# Altium schematic sheet UC3842.SchDoc (part 2 of 2)
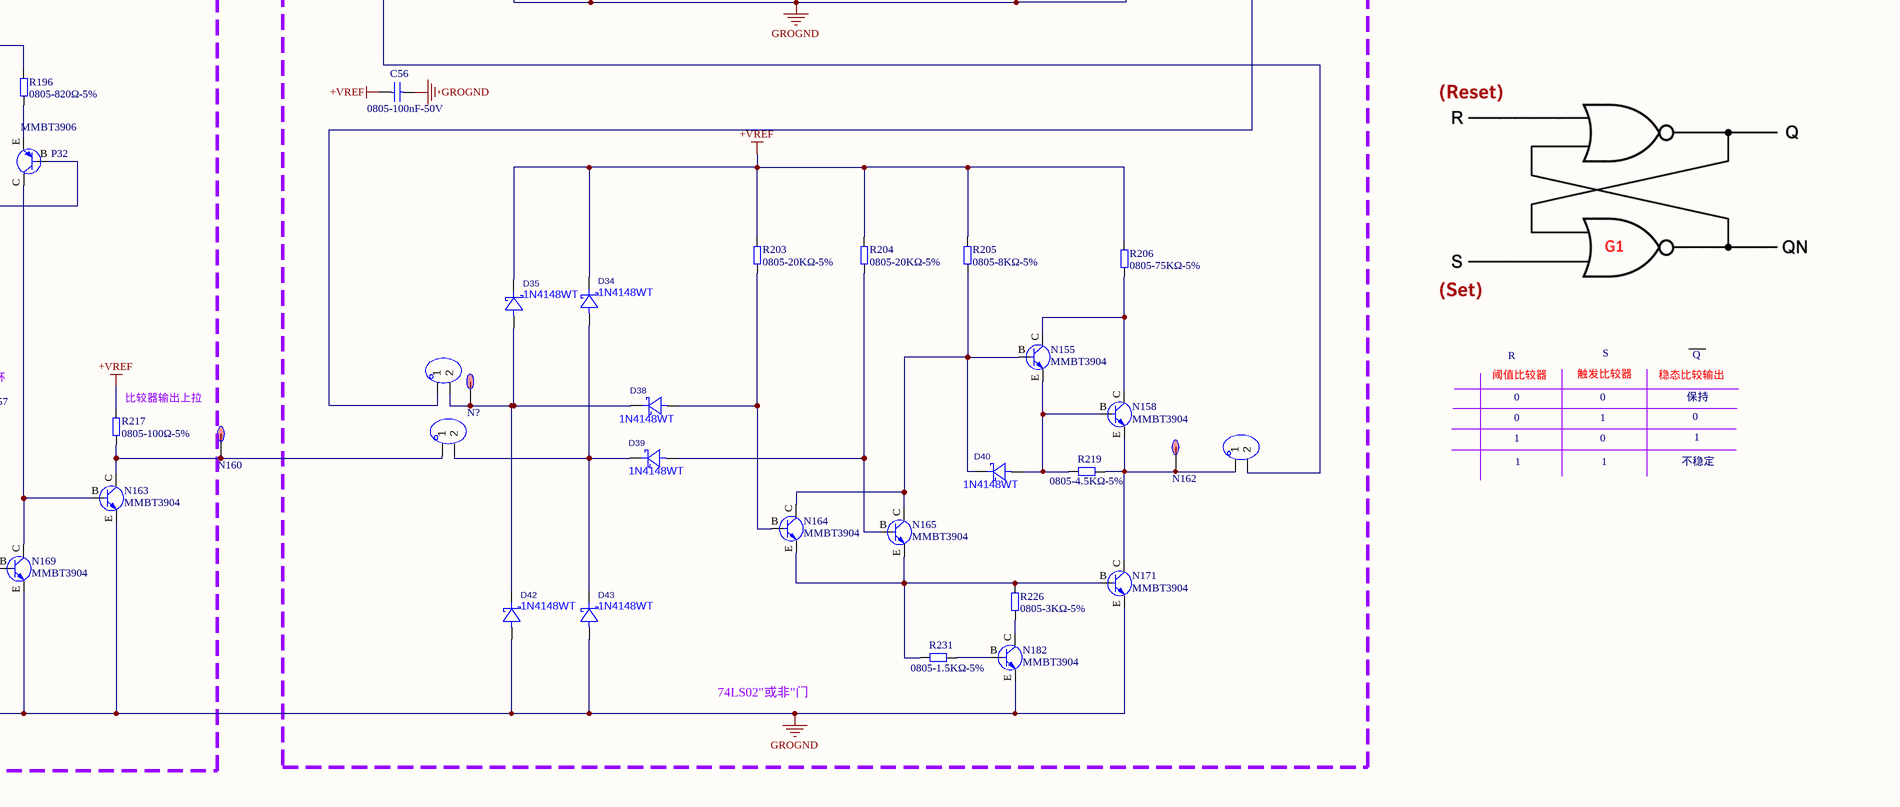
[diagram p11: UC3842.SchDoc, bottom column 3 of 4]

## Nets
+12: H4.2 M1.S
+VREF: C5.1 C7.1 C26.1 C33.1 C34.1 C42.2 C43.2 C45.2 C46.2 C48.2 C49.2 C50.2 C51.2 C54.2 C55.2 C56.2 C57.2 C58.2 C59.2 C60.2 C?#1.2 D7.2(K) D8.2(K) D9.2(K) D10.2(K) D25.2(K) D26.2(K) D34.2(K) D35.2(K) D48.2(K) D?#3.2(K) H3.2 H38.2 H39.2 H44.1 H44.2 H?#12.2 N17.1 N79.C N83.C N84.C N159.C P15.E P16.E P38.E Q8.E R84.2 R85.2 R86.2 R87.2 R88.2 R89.2 R90.2 R91.2 R113.2 R115.2 R116.2 R117.2 R118.2 R119.2 R120.2 R121.2 R122.2 R123.2 R124.2 R125.2 R126.2 R127.2 R128.2 R129.2 R130.2 R131.2 R132.2 R133.2 R154.2 R155.2 R156.2 R157.2 R158.2 R160.2 R161.2 R162.2 R181.2 R182.2 R183.2 R184.2 R185.1 R196.2 R197.2 R198.2 R199.2 R203.2 R204.2 R205.2 R206.2 R209.2 R211.2 R211.3 R216.1 R217.2 R218.2 R235.2 R236.2 R237.2 R238.2 R241.2 R242.1 R?#22.2 R?#23.2 R?#24.2 U1.3(DRAIN) ZD14.2(K) ZD15.2(K) ZD16.2(K) ZD17.2(K) ZD37.2(K) ZD38.2(K) ZD39.2(K) ZD40.2(K) ZD54.1(A) ZD61.2(K) ZD63.2(K)
COMP: C32.2 C?#2.2 COMP2.1 H32.1 H?#9.1 H?#9.2 N149.C N150.C N153.C Q??.2(C) R191.1 R192.1 ZD60.2(K)
GND: C25.2 C40.2 N90.E R46.1 R140.1
GROGND: C3.2 C4.2 C5.2 C6.2 C7.2 C8.2 C9.2 C10.2 C11.2 C12.2 C13.2 C15.2 C16.2 C17.2 C18.2 C19.2 C21.2 C22.2 C23.2 C26.2 C29.2 C30.2 C33.2 C34.2 C37.2 C38.2 C39.2 C41.2 C42.1 C43.1 C44.1 C45.1 C46.1 C47.2 C48.1 C49.1 C50.1 C51.1 C52.1 C53.2 C54.1 C55.1 C56.1 C57.1 C58.1 C59.1 C60.1 C?#1.1 D3.1(A) D5.1(A) D19.1(A) D20.1(A) D21.1(A) D22.1(A) D23.1(A) D30.1(A) D31.1(A) D42.1(A) D43.1(A) D?#2.1(A) D?#7.1(A) H43.1 H43.2 H?#6.1 H?#6.2 M3.S N29.E N35.E N38.E N44.E N47.E N49.E N54.E N59.E N73.E N75.E N76.E N77.E N95.E N102.E N107.E N110.E N111.E N112.E N117.E N119.E N121.E N122.E N134.E N135.E N136.E N137.E N138.E N144.E N145.E N148.E N153.E N161.E N163.E N166.E N169.E N170.E N171.E N172.E N173.E N178.E N179.E N180.E N182.E N185.E N186.E N187.E N188.E N189.E N?#9.E N?#12.E N?#14.E N?#28.E N?#29.E P9.C P11.C P17.C P23.C P25.C P26.C P29.C P39.C P40.C P41.C P49.C P50.C P?#3.C Q2.E Q3.E R53.1 R61.1 R65.1 R66.1 R70.1 R71.1 R72.1 R73.1 R74.1 R75.1 R80.1 R82.1 R83.1 R106.2 R107.2 R149.1 R150.1 R152.1 R153.1 R159.1 R163.1 R175.1 R176.2 R180.2 R187.2 R193.2 R201.2 R208.1 R210.1 R227.2 R228.2 R232.1 R233.1 R234.1 R240.1 R244.1 R246.1 R?#15.1 R?#18.1 R?#19.1 R?#20.1 R?#21.1 ZD11.A ZD27.1(A) ZD28.1(A) ZD29.1(A) ZD30.1(A) ZD31.2(K) ZD32.2(K) ZD36.1(A) ZD48.1(A) ZD49.1(A) ZD50.1(A) ZD51.1(A) ZD52.2(K) ZD53.2(K) ZD59.1(A) ZD60.1(A) ZD62.1(A)
VC: C44.2 C52.2 H?#11.1 N129.C P28.E R164.1 R245.2 ZD3.2(K) ZD8.2(K)
VCC: C1.1 C2.1 C9.1 C10.1 C23.1 C30.1 H?#4.1 H?#4.2 N11.1 Q1.2(S) R27.2 R38.2 R40.2 ZD5.K ZD6.K ZD7.K
VFB: COMP3.1 H?#5.1 H?#5.2 H?#8.1 H?#8.2 N149.B N151.E R?#28.1
CUR: H39.1 H?#3.1 H?#3.2 R223.1
FAULT: C40.1 D48.1(A) H7.1 H23.1 N186.C N199.1 R242.2 R243.1 ZD64.2(K)
Iout: H42.2 N152.B N183.B
ISENSES: H?#10.1 H?#10.2 N181.1 R225.2 R229.1
RT/CT: H?#7.1 H?#7.2 H?#15.1 N?#31.1
VOT: H38.1 H?#1.1 H?#1.2 R222.1
VOUT: C24.2 H?#2.1 H?#2.2 M2.S M3.D N78.E N80.1 P14.C R110.1 R112.2 R114.2 ZD33.A
NetC1_2: C1.2 R11.2
NetC2_2: C2.2 D4.2(K) N32.1 P8.B Q2.C Q3.C R40.1
NetC3_1: C3.1 C4.1 N4.1 N10.2(C) N15.2(C) R6.1 R8.1 R9.2 R10.2 R12.2 R13.2 R14.2
NetC6_1: C6.1 C8.1 H4.1 N16.E N20.B N24.C R30.2 R32.2 R36.3 ZD4.1(A)
NetC11_1: C11.1 N7.1 P5.E Q1.3(D) R11.1 R24.2 ZD2.2(K) ZD4.2(K) ZD10.2(K)
NetC12_1: C12.1 C13.1 N9.1 N18.2(C) N22.2(C) R16.1 R18.2 R19.1 R20.2 R22.2 R23.2 R26.2
NetC15_1: C15.1 C17.1 H5.2 N1.1 R1.2 R2.2
NetC16_1: C16.1 C18.1 N2.1 N?#1.2(C) N?#3.2(C) R1.1 R2.1 R?#1.2 R?#2.2 R?#3.2 R?#4.2 R?#5.2
NetC19_1: C19.1 N41.1 Q3.B R42.1 R70.2
NetC21_1: C21.1 N42.1 P8.C Q2.B R71.2
NetC22_1: C22.1 D4.1(A) N33.1 R38.1 ZD13.K
NetC24_1: C24.1 P12.E R95.2 ZD18.2(K)
NetC25_1: C25.1 N90.B R138.2 R140.2
NetC27_1: C27.1 P26.B ZD34.2(K) ZD68.1(A)
NetC27_2: C27.2 C28.2 R153.2 ZD36.2(K)
NetC28_1: C28.1 H21.1 H21.2
NetC29_1: C29.1 N94.B N99.1 R130.1 R143.2
NetC32_1: C32.1 N150.B N151.B N151.C N180.C N194.1 Q7.C ZD62.2(K)
NetC35_1: C35.1 N161.B N167.C N168.C R214.1
NetC35_2: C35.2 N161.C R213.1
NetC36_1: C36.1 N159.E
NetC36_2: C36.2 R?#29.2 R?#29.3
NetC37_1: C37.1 N174.1 R218.1 ZD63.1(A) ZD69.K
NetC38_1: C38.1 N175.1 P38.C R211.1 R233.2 ZD61.1(A) ZD64.1(A) ZD66.1(A) ZD67.1(A)
NetC39_1: C39.1 H40.1 H41.2 R229.2
NetC41_1: C41.1 D47.1(A) N200.1 P49.B R245.1 R246.2
NetC47_1: C47.1 D6.1(A) H8.1 N?#16.1 R96.1
NetC53_1: C53.1 D24.1(A) H25.1 N?#21.1 R167.1
NetC?#2_1: C?#2.1 R?#28.2 R?#28.3
NetCOMP1_1: COMP1.1 Q??.3(E) R185.2
NetD1_1: D1.1(A) N16.B R28.2
NetD1_2: D1.2(K) R13.1
NetD2_1: D2.1(A) N23.B R39.2
NetD2_2: D2.2(K) R26.1
NetD3_2: D3.2(K) N13.B R12.1
NetD5_2: D5.2(K) N21.B R22.1
NetD6_2: D6.2(K) H19.2 H?#13.1 R94.2 R96.2
NetD7_1: D7.1(A) D18.2(K) D22.2(K) H20.2
NetD8_1: D8.1(A) D14.2(K) D21.2(K) H16.2
NetD9_1: D9.1(A) D11.2(K) D20.2(K) H14.2
NetD10_1: D10.1(A) D16.2(K) D19.2(K) H17.2 N?#18.1
NetD11_1: D11.1(A) N89.1 N115.B R117.1
NetD12_1: D12.1(A) N86.E N91.B R139.2
NetD12_2: D12.2(K) D17.2(K) N86.B N96.C R124.1
NetD13_A: D13.A R131.1
NetD13_K: D13.K H16.1 N92.1 N95.C
NetD14_1: D14.1(A) N114.B R120.1
NetD15_1: D15.1(A) N81.E N87.B R141.2
NetD15_2: D15.2(K) N81.B N101.C R115.1
NetD16_1: D16.1(A) N96.B R126.1
NetD17_1: D17.1(A) H19.1 N91.E N110.C N?#19.1 R139.1
NetD18_1: D18.1(A) N108.1 N113.B R122.1
NetD23_2: D23.2(K) N113.E N114.E N115.E
NetD24_2: D24.2(K) H?#14.2 R165.2 R167.2
NetD25_1: D25.1(A) D27.2(K) D31.2(K) H29.2 N?#26.1
NetD26_1: D26.1(A) D28.2(K) D30.2(K) H30.2 N?#27.1
NetD27_1: D27.1(A) N142.B R181.1
NetD28_1: D28.1(A) N143.B R182.1
NetD29_1: D29.1(A) N139.E N140.B R186.1
NetD29_2: D29.2(K) N139.B N142.C N143.C R183.1
NetD32_1: D32.1(A) P35.C
NetD33_1: D33.1(A) P34.C
NetD33_2: D33.2(K) D37.2(K) P37.B P39.E
NetD34_1: D34.1(A) D39.2(K) D43.2(K) H36.2
NetD35_1: D35.1(A) D38.2(K) D42.2(K) H35.2 N?#30.1
NetD36_1: D36.1(A) H33.2 N157.1 P40.B
NetD36_2: D36.2(K) P36.B P40.E
NetD37_1: D37.1(A) H41.1 N195.1 P39.B
NetD38_1: D38.1(A) N164.B R203.1
NetD39_1: D39.1(A) N165.B R204.1
NetD40_1: D40.1(A) N155.E N158.B R219.1
NetD40_2: D40.2(K) N155.B N164.C N165.C R205.1
NetD41_1: D41.1(A) P41.B
NetD44_1: D44.1(A) P45.C
NetD44_2: D44.2(K) D47.2(K) P48.B P49.E
NetD45_1: D45.1(A) P46.C
NetD45_2: D45.2(K) D46.2(K) P47.B P50.E
NetD46_1: D46.1(A) N198.1 P50.B R241.1 R243.2 R244.2
NetD?#1_1: D?#1.1(A) N?#4.B R?#6.2
NetD?#1_2: D?#1.2(K) R?#5.1
NetD?#2_2: D?#2.2(K) N?#2.B R?#3.1
NetD?#3_1: D?#3.1(A) D?#5.2(K) D?#7.2(K) H?#13.2 N?#24.1
NetD?#4_1: D?#4.1(A) N?#22.E N?#23.B R?#25.2
NetD?#4_2: D?#4.2(K) D?#6.2(K) N?#22.B N?#25.C R?#22.1
NetD?#5_1: D?#5.1(A) N?#25.B R?#24.1
NetD?#6_1: D?#6.1(A) H?#14.1 N?#23.E N?#28.C R?#25.1
NetH1_1: H1.1 N8.1 P5.C R16.2 R19.2 R29.2
NetH1_2: H1.2 N3.1 R6.2 R8.2
NetH2_1: H2.1 H2.2 M1.G R46.2 ZD3.1(A)
NetH3_1: H3.1 N?#4.E N?#5.B N?#7.C R?#7.2 R?#8.2 R?#11.3 ZD2.1(A)
NetH5_1: H5.1 N23.E N31.B N34.C R43.2 R44.2 R?#10.3 ZD10.1(A)
NetH6_1: H6.1 N?#15.1 R94.1
NetH6_2: H6.2 ZD14.1(A) ZD19.2(K) ZD27.2(K)
NetH7_2: H7.2 ZD16.1(A) ZD20.2(K) ZD29.2(K)
NetH8_2: H8.2 ZD15.1(A) ZD21.2(K) ZD28.2(K)
NetH9_1: H9.1 N63.E N73.C R99.1
NetH9_2: H9.2 N71.1 R100.2
NetH10_1: H10.1 R100.1
NetH10_2: H10.2 ZD17.1(A) ZD23.2(K) ZD30.2(K)
NetH11_1: H11.1 N65.E N68.1 N75.C R102.1
NetH11_2: H11.2 R103.2
NetH12_1: H12.1 N90.C N190.1 R129.1
NetH12_2: H12.2 H14.1 H29.1
NetH15_1: H15.1 N83.E N102.C P22.E R134.1
NetH15_2: H15.2 N88.1 R138.1
NetH17_1: H17.1 N87.E N111.C N?#17.1 R141.1
NetH20_1: H20.1 H31.2 H35.1
NetH22_1: H22.1 N?#20.1 R165.1
NetH22_2: H22.2 ZD37.1(A) ZD41.2(K) ZD48.2(K)
NetH23_2: H23.2 ZD39.1(A) ZD42.2(K) ZD50.2(K)
NetH25_2: H25.2 ZD38.1(A) ZD43.2(K) ZD49.2(K)
NetH26_1: H26.1 R169.1
NetH26_2: H26.2 ZD40.1(A) ZD45.2(K) ZD51.2(K)
NetH27_1: H27.1 N126.E N135.C R168.1
NetH27_2: H27.2 N133.1 R169.2
NetH28_1: H28.1 N128.E N132.1 N136.C R171.1
NetH28_2: H28.2 R172.2
NetH30_1: H30.1 H37.2
NetH31_1: H31.1 N140.E N141.1 N144.C R186.2
NetH32_2: H32.2 H45.1 N146.1 N170.C P41.E ZD57.1(A) ZD66.2(K)
NetH33_1: H33.1 N147.1 R190.1 R193.1 ZD59.2(K)
NetH34_1: H34.1 H34.2 R200.2
NetH36_1: H36.1 N160.1 N163.C R217.1
NetH37_1: H37.1 N158.E N162.1 N171.C R219.2
NetH40_2: H40.2 R?#29.1
NetH42_1: H42.1 N184.B N184.C N197.1 R239.1 U1.1(GATE)
NetH45_2: H45.2 P30.E R195.2
NetH?#11_2: H?#11.2 M2.D R92.2
NetH?#12_1: H?#12.1 N84.B
NetH?#15_2: H?#15.2 N159.B
NetM1_D: M1.D ZD8.1(A)
NetM2_G: M2.G N70.1 R104.2 R110.2 ZD24.1(A)
NetM3_G: M3.G N193.1 R173.2 R175.2 ZD46.1(A)
NetN10_1: N10.1(B) N16.C N38.C P4.C P9.E R48.2
NetN10_3: N10.3(E) N15.1(B) N15.3(E) R28.1 R30.1 R32.1
NetN13_C: N13.C R14.1
NetN13_E: N13.E R31.2
NetN18_1: N18.1(B) N23.C N49.C P7.C P11.E R60.2
NetN18_3: N18.3(E) N22.1(B) N22.3(E) R39.1 R43.1 R44.1
NetN20_C: N20.C N25.C P3.B P3.C P4.B
NetN20_E: N20.E N28.C
NetN21_C: N21.C R23.1
NetN21_E: N21.E R45.2
NetN24_B: N24.B R36.1 R36.2 R53.2
NetN24_E: N24.E N28.B R50.2
NetN25_B: N25.B R31.1 R49.2
NetN25_E: N25.E N28.E N40.C R50.1 R56.2 R57.2
NetN29_B: N29.B ZD9.A
NetN29_C: N29.C R33.1 ZD11.K
NetN31_C: N31.C N36.C P6.B P6.C P7.B
NetN31_E: N31.E N37.C
NetN34_B: N34.B R65.2 R?#10.1 R?#10.2
NetN34_E: N34.E N37.B R63.2
NetN35_B: N35.B R61.2 ZD13.A
NetN35_C: N35.C R41.1
NetN36_B: N36.B R45.1 R59.2
NetN36_E: N36.E N37.E N52.C R63.1 R67.2 R68.2
NetN38_B: N38.B R49.1 R66.2
NetN39_B: N39.B N46.C R56.1
NetN39_C: N39.C N47.C P9.B R48.1
NetN39_E: N39.E N47.B R74.2
NetN40_B: N40.B N44.C R57.1
NetN40_E: N40.E N44.B N46.B R72.2
NetN46_E: N46.E R73.2
NetN49_B: N49.B R59.1 R75.2
NetN51_B: N51.B N55.C R68.1
NetN51_C: N51.C N59.C P11.B R60.1
NetN51_E: N51.E N59.B R83.2
NetN52_B: N52.B N54.C R67.1
NetN52_E: N52.E N54.B N55.B R80.2
NetN55_E: N55.E R82.2
NetN60_B: N60.B N62.C R87.1 ZD22.2(K)
NetN60_C: N60.C N63.C R84.1
NetN60_E: N60.E N63.B R99.2 ZD22.1(A)
NetN61_B: N61.B N64.C R91.1 ZD25.2(K)
NetN61_C: N61.C N65.C R88.1
NetN61_E: N61.E N65.B R102.2 ZD25.1(A)
NetN62_B: N62.B N66.C R86.1
NetN62_E: N62.E N73.B R105.1 R109.1
NetN64_B: N64.B N67.C R90.1
NetN64_E: N64.E N75.B R108.1 R111.1
NetN66_B: N66.B R85.1 ZD19.1(A) ZD21.1(A)
NetN66_E: N66.E ZD31.1(A)
NetN67_B: N67.B R89.1 ZD20.1(A) ZD23.1(A)
NetN67_E: N67.E ZD32.1(A)
NetN69_B: N69.B P13.C P14.B R112.1
NetN69_C: N69.C P12.C P13.E R93.1 R97.1
NetN69_E: N69.E N74.1 P14.E R101.1 R104.1
NetN72_B: N72.B R103.1 R106.1
NetN72_C: N72.C P13.B R93.2
NetN72_E: N72.E R107.1
NetN76_B: N76.B R109.2
NetN76_C: N76.C R105.2
NetN77_B: N77.B R111.2
NetN77_C: N77.C R108.2
NetN78_B: N78.B R114.1 ZD26.A
NetN78_C: N78.C R98.2 ZD33.K
NetN79_B: N79.B N85.C P22.B P22.C R127.1
NetN79_E: N79.E N83.B R134.2
NetN81_C: N81.C N87.C R113.1
NetN82_1: N82.1 N85.B N107.C P16.C R137.2
NetN84_E: N84.E ZD35.1(A)
NetN85_E: N85.E R142.2 R147.2 R152.2
NetN86_C: N86.C N91.C R125.1
NetN94_C: N94.C N103.C P17.B P19.B P19.C
NetN94_E: N94.E N103.B
NetN95_B: N95.B ZD65.A
NetN96_E: N96.E N110.B R144.2 R146.2
NetN97_1: N97.1 N105.C R133.1 ZD65.K
NetN98_B: N98.B R135.1 RTCT1.1 ZD68.2(K)
NetN98_C: N98.C N106.C P18.B P18.C P20.B
NetN98_E: N98.E N106.B
NetN100_B: N100.B N100.C P27.E R136.1
NetN100_E: N100.E N107.B N112.C
NetN101_B: N101.B N104.1 N113.C N114.C N115.C R118.1
NetN101_E: N101.E N111.B R145.2 R151.1
NetN102_B: N102.B R142.1
NetN103_E: N103.E N106.E R149.2
NetN105_B: N105.B N109.1 N191.C R132.1
NetN105_E: N105.E N191.E R163.2
NetN112_B: N112.B N121.C P20.C R137.1
NetN116_1: N116.1 P25.B R143.1 R150.2
NetN117_B: N117.B R146.1
NetN117_C: N117.C R144.1
NetN118_1: N118.1 R148.1
NetN119_B: N119.B R151.2
NetN119_C: N119.C R145.1
NetN120_1: N120.1 N122.C R128.1 R135.2 R135.3 ZD34.1(A)
NetN121_B: N121.B P24.C R159.2
NetN122_B: N122.B P27.C R147.1
NetN123_B: N123.B N125.C R157.1 ZD44.2(K)
NetN123_C: N123.C N126.C R154.1
NetN123_E: N123.E N126.B R168.2 ZD44.1(A)
NetN124_B: N124.B N127.C R162.1 ZD47.2(K)
NetN124_C: N124.C N128.C R158.1
NetN124_E: N124.E N128.B R171.2 ZD47.1(A)
NetN125_B: N125.B N130.C R156.1
NetN125_E: N125.E N135.B R174.1 R178.1
NetN127_B: N127.B N131.C R161.1
NetN127_E: N127.E N136.B R177.1 R179.1
NetN129_B: N129.B P28.C P29.B R180.1
NetN129_E: N129.E N192.1 P29.E R170.1 R173.1
NetN130_B: N130.B R155.1 ZD41.1(A) ZD43.1(A)
NetN130_E: N130.E ZD52.1(A)
NetN131_B: N131.B R160.1 ZD42.1(A) ZD45.1(A)
NetN131_E: N131.E ZD53.1(A)
NetN134_B: N134.B R172.1 R176.1
NetN134_C: N134.C R166.2
NetN137_B: N137.B R178.2
NetN137_C: N137.C R174.2
NetN138_B: N138.B R179.2
NetN138_C: N138.C R177.2
NetN139_C: N139.C N140.C R184.1
NetN142_E: N142.E N143.E N144.B R188.2 R189.1
NetN145_B: N145.B R189.2
NetN145_C: N145.C R188.1
NetN148_B: N148.B P30.C R200.1 R201.1
NetN148_C: N148.C P30.B R195.1
NetN149_E: N149.E N154.B R207.1
NetN150_E: N150.E R202.1
NetN152_C: N152.C P31.B P32.B P33.B P33.C P34.B P35.B
NetN152_E: N152.E R210.2
NetN153_B: N153.B R202.2 R208.2
NetN154_C: N154.C Q6.B Q6.C Q7.B
NetN154_E: N154.E R213.2
NetN155_C: N155.C N158.C R206.1
NetN156_1: N156.1 P38.B R209.1 R220.2
NetN163_B: N163.B N169.C P32.C
NetN164_E: N164.E N165.E N171.B R226.2 R231.1
NetN166_B: N166.B N166.C N167.B N168.B R215.1 R230.2
NetN167_E: N167.E N168.E R234.2
NetN169_B: N169.B N179.C P36.C
NetN170_B: N170.B N176.1 R222.2 R227.1
NetN172_B: N172.B R232.2 ZD69.A
NetN172_C: N172.C R220.1
NetN173_B: N173.B N177.1 R223.2 R228.1
NetN173_C: N173.C R221.2 ZD67.2(K)
NetN178_B: N178.B N178.C N179.B P37.C
NetN180_B: N180.B R230.1
NetN182_B: N182.B R231.2
NetN182_C: N182.C R226.1
NetN183_C: N183.C P42.B P43.B P44.B P44.C P45.B P46.B
NetN183_E: N183.E R240.2
NetN184_E: N184.E N185.B N185.C
NetN186_B: N186.B N187.C P43.C
NetN187_B: N187.B N189.C P47.C
NetN188_B: N188.B N188.C N189.B P48.C
NetN191_B: N191.B ZD35.2(K)
NetN?#1_1: N?#1.1(B) N?#4.C N?#9.C P?#2.C P?#3.E R?#13.2
NetN?#1_3: N?#1.3(E) N?#3.1(B) N?#3.3(E) R?#6.1 R?#7.1 R?#8.1
NetN?#2_C: N?#2.C R?#4.1
NetN?#2_E: N?#2.E R?#9.2
NetN?#5_C: N?#5.C N?#6.C P?#1.B P?#1.C P?#2.B
NetN?#5_E: N?#5.E N?#8.C
NetN?#6_B: N?#6.B R?#9.1 R?#12.2
NetN?#6_E: N?#6.E N?#8.E N?#11.C R?#14.1 R?#16.2 R?#17.2
NetN?#7_B: N?#7.B R?#11.1 R?#11.2 R?#15.2
NetN?#7_E: N?#7.E N?#8.B R?#14.2
NetN?#9_B: N?#9.B R?#12.1 R?#18.2
NetN?#10_B: N?#10.B N?#13.C R?#17.1
NetN?#10_C: N?#10.C N?#14.C P?#3.B R?#13.1
NetN?#10_E: N?#10.E N?#14.B R?#21.2
NetN?#11_B: N?#11.B N?#12.C R?#16.1
NetN?#11_E: N?#11.E N?#12.B N?#13.B R?#19.2
NetN?#13_E: N?#13.E R?#20.2
NetN?#22_C: N?#22.C N?#23.C R?#23.1
NetN?#25_E: N?#25.E N?#28.B R?#26.2 R?#27.2
NetN?#29_B: N?#29.B R?#27.1
NetN?#29_C: N?#29.C R?#26.1
NetP3_E: P3.E R9.1
NetP4_E: P4.E R10.1
NetP5_B: P5.B R24.1 R33.2
NetP6_E: P6.E R20.1
NetP7_E: P7.E R18.1
NetP8_E: P8.E R37.1
NetP12_B: P12.B R95.1 R98.1
NetP15_B: P15.B P15.C P16.B P21.B R136.2
NetP17_E: P17.E P20.E R116.1
NetP18_E: P18.E R121.1
NetP19_E: P19.E R119.1
NetP21_C: P21.C P23.E P24.E
NetP21_E: P21.E R123.1
NetP23_B: P23.B P25.E
NetP24_B: P24.B P26.E
NetP27_B: P27.B R148.2
NetP28_B: P28.B R164.2 R166.1
NetP31_C: P31.C P36.E P37.E
NetP31_E: P31.E R199.1
NetP32_E: P32.E R196.1
NetP33_E: P33.E R197.1
NetP34_E: P34.E P35.E R198.1
NetP42_C: P42.C P47.E P48.E
NetP42_E: P42.E R238.1
NetP43_E: P43.E R235.1
NetP44_E: P44.E R236.1
NetP45_E: P45.E P46.E R237.1
NetP?#1_E: P?#1.E R?#2.1
NetP?#2_E: P?#2.E R?#1.1
NetQ1_1: Q1.1(G) R27.1 R41.2 ZD5.A
NetQ6_E: Q6.E R191.2
NetQ7_E: Q7.E R192.2
NetQ8_B: Q8.B R216.2 R221.1
NetQ8_C: Q8.C R225.1
NetQ??_1: Q??.1(B) R187.1 ZD56.2(K)
NetR29_1: R29.1 ZD9.K
NetR37_2: R37.2 ZD6.A
NetR42_2: R42.2 ZD7.A
NetR92_1: R92.1 ZD18.1(A)
NetR97_2: R97.2 ZD26.K
NetR101_2: R101.2 ZD24.2(K)
NetR170_2: R170.2 ZD46.2(K)
NetR190_2: R190.2 ZD58.2(K)
NetR207_2: R207.2 R212.2 R215.2
NetR212_1: R212.1 R214.2
NetR239_2: R239.2 U1.2(SOURCE)
NetZD54_2: ZD54.2(K) ZD55.1(A)
NetZD55_2: ZD55.2(K) ZD56.1(A)
NetZD57_2: ZD57.2(K) ZD58.1(A)

Not connected (* = marked no-connect by the designer): D32 2(K); D41 2(K); N196 1

## Notes on the sheet
- Vc欠压保护
- (near H?#2) PWM输出
- (near H?#1) 电压环保护触电
- (near H?#3) 电流环保护触电
- 恒流源
- (near H?#4) 外部电源输入
- (near H?#5) 外部电阻分压2.5V
- (near H?#7) 谐波补偿
- (near H?#8) 外置环路补偿
- (near H?#10) 电流环电压
- (near N11) 12V~28V
- 输入过压有滞回，欠压无滞回
- 输入过欠压保护
- (near C1) RC峰值吸收
- 修改一
- 镜像电流源
- +
- (near P49) [N+]
- (near N198) [N-]
- (near R244) Vout​ =2.5V
- 小于12V时输出为：低电平
- 正常时输出为：高电平
- (near N198) -
- 过压释放阈值
- 前提要大于内部电压
- (near H2) 外部源输入
- Vout​ ≈2.84V
- 凡是有电感的地方都要给我进行电流复位
- 凡是有电容的地方都要给我进行电压复位
- (near ZD7) 过压自锁阈值
- 比较器偏置电路
- 不复位意味着你做的任何一个逻辑有可前能失交
- GS是否需要连接
- 正常的电路设计不管是PMOS还是NMOS的GS必须加电阻
- Vbeq1
- PMOS能否反接
- 我们这个电路Gs增加电阻不行因为Vwai会直接经过Gs电阻到vc端
- (near N28) Ic3
- Ic2
- (near R50) Vbeq2
- (near P9) Ic4
- 15V
- 隔离二极管
- (near ZD13) 抬升二极管
- (near R57) Ir
- (near R57) Ie1
- (near R56) Ic4
- Vbeq3
- (near P11) Ic4
- (near P?#3) Ic4
- (near N44) Ib1
- Ib2
- Ie2
- Ib3
- (near N39) Ic2
- (near N47) Ic3
- (near N44) Ic0
- Ic1
- (near N51) Ic2
- (near N59) Ic3
- (near N?#10) Ic2
- (near N?#14) Ic3
- (near H?#11) 外部电源选择输入
- (near N190) PWM取反输出测试点
- τ = R × C = 1µs
- (near C24) 自举电容
- (near R128) 调节频率
- 触发器输出测试点
- (near N80) 浮地
- (near ZD34) 充电
- 放电
- (near P21) wilson电流镜
- 触发器比较输出
- (near N88) PWM输出测试点
- (near N84) 施密特触发器输入
- PWM
- (near R135) 调节窄脉冲的宽度
- (near RTCT1) 三角波
- 比较器输出
- (near R137) 复位
- (near H15) 输出
- (near R132) 低阈值分压电阻
- (near R133) 高阈值分压电阻
- (near N95) 5V欠压逻辑信号输出
- Vref Good
- 外部时钟同步
- 比较器正端
- 阈值
- (near N94) 比较器负端
- (near R143) 2/3VCC
- (near N99) 阈值测试点
- (near P26) 触发
- (near P25) 比较器正端
- 欠压输出：高电平
- 正常输出：低电平
- Q\
- (near N116) 触发测试点
- (near N116) 1/3VCC
- 复位
- (near N118) 复位输出测试点
- 修改二：加了一个电容
- (near R159) 比较输出
- (near N121) 触发比较器输出
- (near N120) 放电
- (near R163) 高低阈值下分压电阻
- f
- 1
- F
- ≃
- (R1 + 2R2) * C
- 1.44
- 100Khz
- 系统框图
- (near C53) τ = R × C = 1µs
- (near P29) 此推挽电路（上N下P）优缺点：
- (near P29) 充电是射级跟随器
- (near P29) 充电电流越来越小
- (near P29) 放电电流越来越小
- 缺点：充放电都不是很快
- 优缺点：上下管子导通后会自锁
- 误差放大器同相输入未被引至一个引脚
- 而是在内部被施加偏压至 2.5V±2%。
- C1
- 从而使用户能够控制转换器的闭环频率响应。
- E/A 输出可在引脚 1 上提供（用于外部补偿）
- 然后一个Vbe导通压降0.6V
- 基极电压会被钳位到1.8V
- 最小工作电压为：1.8V
- Ri
- 外部分压
- Ie =
- 3*Vpn - Vbe
- 1200R
- (near H31) 取反输出
- Rd
- 基准电压
- -
- (near N146) 电压环测试点
- Vmin = 1.4V
- Vmax = 4.4V
- 最大占空比的限制通过稳压管来实现
- (near N147) 电压环测试点
- 比较器
- 74LS02"或非"门
- (near R?#28) 同相输入端
- (near N194) 放大器测试点
- (near COMP3) 外部分压2.5V
- 电压环软启动
- 0.7V
- (near R207) 反相输入端
- 第二阶段软启动
- 启动后电容掉电复位
- (near N195) +
- [N+]
- [N-]
- (near N157) 电压环
- (near R217) 比较器输出上拉
- 阈值比较器
- R
- 0
- 触发比较器
- S
- 稳态比较输出
- 保持
- Q
- 第一阶段软启动
- (near H38) 外部触发
- (near H39) 外部触发
- (near N?#31) 斜波补偿
- (near N195) 电流环
- (near ZD64) 初始上电通过电容电平下拉复位
- 5V电压建立后，立刻将将FAULT电压拉低
- 振荡器斜坡的一部分可以与电流检测信号进行电阻相加
- 以便为占空比超过50%的转换器提供斜坡补偿
- 不稳定
- (near P41) 初始上电拉电压外环
- (near D41) 电容电压越高PNP放大电流越小
- (near N170) 电压环保护触电
- (near R228) 电流环保护触电
- (near C38) 软启电容
- 拉低软启电容确保保护后还能软起
- 接检流电阻
- 2段软启动
- 电压环启动波形
- 启动后，需要再次复位
- 这个三极管分为三个阶段
- 第一个阶段：恒流源的1mA电流全部从三极管走
- RC<<T
- (near C39) RC滤波
- 第二个阶段：恒流源的1mA电流部分从三极管走
- 第三个阶段：恒流源的1mA电流不从三极管走
- Labels drawn without touching a wire or pin: RT/CT

## Library data of the parts
C1 C2 C10 C19 C21 C25 C30 C37 C38 = CAP_CC_SMD_5: 物料号: *; 物料描述: *
C3 C5 C6 C9 C11 C12 C15 C16 C22-C24 C33 = CAP_EC_1: 贴片铝电解电容（RVT1V101M0607）; Part Number: *; Brand: *
C4 C7 C8 C13 C17 C18 C26-C29 C34 C36 = CAP_CC_SMD_3: 物料号: *; 物料描述: *
C32 C35 C?#2 = CAP_CC_SMD_2: 品牌: muRATA; Part Number: *; 供应商物料号: *; 型号规格: *
C39-C41 = CAP_CC_SMD_4: 物料号: *; 物料描述: *
C42-C60 C?#1 = C0603: Capacitor; Value: 104; Published: 8-Jun-2000; LatestRevisionDate: 17-Jul-2002; LatestRevisionNote: Re-released for DXP Platform.; Publisher: Altium Limited
COMP1-COMP3 N1-N4 N7-N9 N11 N17 N32 N33 N41 N42 N68 N70 N71 N74 N80 N82 N88 N89 N92 N97 N99 N104 N108 N109 N116 N118 N120 N132 N133 N141 N146 N147 N156 N157 N160 N162 N174-N177 N181 N190 N192-N200 N?#15-N?#21 N?#24 N?#26 N?#27 N?#30 N?#31 RTCT1 = 测试点: value: *
D1 D2 D5 D?#1 D?#2 = 1N4148W_C7420318: Symbol: 1N4148W_C7420318
D4 D6 D24 ZD2-ZD4 ZD8 ZD10 ZD14-ZD25 ZD27-ZD32 ZD34-ZD64 ZD66-ZD68 = 1N4148WT: 二极管配置:独立式;整流电流:150mA;直流反向耐压(Vr):100V;正向压降(Vf):1.25V@150mA;反向恢复时间(Trr):4ns;; Manufacturer: R+O(宏嘉诚); Symbol: 1N4148WT_C7420320; AddInBom: yes; ModelId: 8f56a03db567494d8f4c9d12aa52a741; ModelName: SOD-523_L1.2-W0.8-H0.7-LS1.6; ModelTransform: 62.992,31.496,0,0,0,0,0,0,0; Diode Configuration: 独立式; Pd - Power Dissipation: 150mW; Current - Rectified: 150mA; Voltage - DC Reverse(Vr): 100V; Non-Repetitive Peak Forward Surge Current: 2A; Reverse Leakage Current (Ir): 1uA@75V; Reverse Recovery Time (trr): 4ns; Operating Junction Temperature Range: -55℃~+150℃; LCSC Part Name: 100V 150mA; SupplierPart: C7420320; ManufacturerPart: 1N4148WT; Supplier Footprint: SOD-523; JLCPCB Part Class: Extended Part; Datasheet: https://item.szlcsc.com/datasheet/1N4148WT/8397142.html; Supplier: LCSC; ConvertToPcb: yes; FootprintName: SOD-523_L1.2-W0.8-LS1.6-FD; Voltage - Forward(Vf@If): 1.25V@150mA
D7-D12 D14-D23 D25-D48 D?#3-D?#7 = 1N4148WT: 二极管配置:独立式;整流电流:150mA;直流反向耐压(Vr):100V;正向压降(Vf):1.25V@150mA;反向恢复时间(Trr):4ns;; Manufacturer: R+O(宏嘉诚); Symbol: 1N4148WT_C7420320; AddInBom: yes; ModelId: 8f56a03db567494d8f4c9d12aa52a741; ModelName: SOD-523_L1.2-W0.8-H0.7-LS1.6; ModelTransform: 62.992,31.496,0,0,0,0,0,0,0; Voltage - DC Reverse(Vr): 100V; Current - Rectified: 150mA; Non-Repetitive Peak Forward Surge Current: 2A; Diode Configuration: 独立式; Pd - Power Dissipation: 150mW; Reverse Leakage Current (Ir): 1uA@75V; Reverse Recovery Time (trr): 4ns; Operating Junction Temperature Range: -55℃~+150℃; LCSC Part Name: 100V 150mA; SupplierPart: C7420320; ManufacturerPart: 1N4148WT; Supplier Footprint: SOD-523; JLCPCB Part Class: Extended Part; Datasheet: https://item.szlcsc.com/datasheet/1N4148WT/8397142.html; Supplier: LCSC; ConvertToPcb: yes; FootprintName: SOD-523_L1.2-W0.8-LS1.6-FD; Voltage - Forward(Vf@If): 1.25V@150mA
D13 = DIO_LED: Brand: LED; Part Number: *
H1-H12 H14-H17 H19-H23 H25-H45 H?#1-H?#15 = pz254v-11-02p: 插针结构:1x2P;间距:2.54mm;行距:-;圆针/方针:方针;安装方式:直插;排数:单排;总PIN位数:2P;额定电流:3A;额定电压:250V;配合针长度:6mm;塑高:2.5mm;端接针长度:3mm;触头材质:黄铜;触头镀层:-;工作温度:-40℃~+105℃;颜色:黑色;; Manufacturer: XFCN(兴飞); AddInBom: yes; ModelId: e35305ec3aa84b66b849f914b715e73f; ModelName: HDR2.54-M-LI-1X2P; ModelTransform: 200,100,0,0,0,0,0,0,-118.11; Pin Structure: 1x2P; Pitch: 2.54mm; Circluar Pins/Square Pins: 方针; Current Rating: 3A; Voltage Rating (Max): 250V; Symbol: PZ254V-11-02P; LCSC Part Name: 1x2P 间距:2.54mm 方针 直插; SupplierPart: C492401; ManufacturerPart: PZ254V-11-02P; Supplier Footprint: 插件,P=2.54mm; JLCPCB Part Class: Extended Part; Datasheet: https://item.szlcsc.com/datasheet/PZ254V-11-02P/502957.html; Supplier: LCSC; ConvertToPcb: yes; FootprintName: HDR-TH_2P-P2.54-V-M; Row Spacing: -; Mounting Type: 直插; Number of Rows: 单排; Number of Pins: 2P; Length of Mating Pin: 6mm; Insulation Height: 2.5mm; Length of End Connection Pin: 3mm; Contact Material: 黄铜; Contact Plating: -; Operating Temperature: -40℃~+105℃; Color: 黑色
M1 = PMOS-2: PMOS，40V/40A; Note: Pin 4 not drawn and electrically connected to Pin 2.; Published: 8-Jun-2000; LatestRevisionDate: 17-Jul-2002; LatestRevisionNote: Re-released for DXP Platform.; DatasheetVersion: PD-9.390D; PackageVersion: Feb-1997; PackageReference: TO-220AB; Publisher: Altium Limited; PackageDescription: TO, Thru-Hole, Vertical, Heatsink Mounted; 3 In-Line Leads; Pitch 2.54 mm; ComponentLink1Description: Manufacturer Link; ComponentLink1URL: http://www.irf.com/
M2 M3 = Nmos_1: 1个N沟道 耐压:40V 电流:45A
N10 N15 N18 N22 N?#1 N?#3 = 2sd882_c90797: 晶体管类型:NPN;集电极电流(Ic):3A;集射极击穿电压(Vceo):30V;耗散功率(Pd):12.5W;直流电流增益(hFE):100@1A,2V;; Manufacturer: ST(意法半导体); AddInBom: yes; ModelId: 5d8cc27ca8d54406b5fd11c1efd06fe1; ModelTransform: 299.212,104.724,0,180,0,0,0,7.874,-196.85; Current - Collector(Ic): 3A; Collector - Emitter Voltage VCEO: 30V; Pd - Power Dissipation: 12.5W; Transition frequency(fT): 100MHz; Current - Collector Cutoff: 100uA; Vce Saturation(VCE(sat)): 400mV; Symbol: 2SD882; LCSC Part Name: NPN 电流:3A 电压:30V; SupplierPart: C90797; ManufacturerPart: 2SD882; Supplier Footprint: TO-126; JLCPCB Part Class: Extended Part; Datasheet: https://item.szlcsc.com/datasheet/2SD882/91985.html; Supplier: LCSC; ConvertToPcb: yes; FootprintName: TO-126-3_L7.6-W2.7-P2.29-R; ModelName: TO-126-3_L7.6-W2.7-P2.29-R; type: NPN; DC Current Gain: 100@1A,2V; Operating Temperature: -65℃~+150℃
N13 N16 N20 N21 N23-N25 N28 N29 N31 N34-N40 N44 N46 N47 N49 N51 N52 N54 N55 N59-N67 N69 N72 N73 N75-N79 N81 N83-N87 N90 N91 N94-N96 N98 N100-N103 N105-N107 N110-N115 N117 N119 N121-N131 N134-N140 N142-N145 N148-N155 N158 N159 N161 N163-N173 N178-N180 N182-N189 N191 N?#2 N?#4-N?#14 N?#22 N?#23 N?#25 N?#28 N?#29 Q2 Q3 = BJT_NPN_1: Part Number: *; Brand: *
P3-P9 P11-P50 P?#1-P?#3 = BJT_PNP_1: Part Number: *; Brand: *
Q1 = do4085a: 数量:1个P沟道;漏源电压(Vdss):40V;连续漏极电流(Id):5A;导通电阻(RDS(on)):90mΩ@10V;耗散功率(Pd):3.8W;阈值电压(Vgs(th)):2.5V;; Manufacturer: DOINGTER(杜因特); AddInBom: yes; ModelId: 89cb27a44ab2466697082bb9fd73a7d0; ModelName: SOT-23-3L_L2.9-W1.6-H1.1-LS2.8-P0.95; ModelTransform: 114.173,110.236,0,90,0,0,0,0,0; Number: 1个P沟道; Drain to Source Voltage: 40V; Current - Continuous Drain(Id): 5A; Pd - Power Dissipation: 3.8W; Gate Threshold Voltage (Vgs(th)): 2.5V; Gate Charge(Qg): 7nC@10V; Input Capacitance(Ciss): 570pF; Reverse Transfer Capacitance (Crss@Vds): 40pF; Type: P沟道; Output Capacitance(Coss): 50pF; Symbol: DO4085A; LCSC Part Name: P沟道MOSFET; SupplierPart: C47018569; ManufacturerPart: DO4085A; Supplier Footprint: SOT-23; JLCPCB Part Class: Extended Part; Datasheet: https://item.szlcsc.com/datasheet/DO4085A/49200335.html; Supplier: LCSC; ConvertToPcb: yes; FootprintName: SOT-23-3_L2.9-W1.6-P1.90-LS2.8-BR; RDS(on): 90mΩ@10V; Operating Temperature: -55℃~+150℃
Q6-Q8 = BJT_PNP: PNP/30V/3A; Part Number: *; Brand: *
Q?? = b772_c41375134: 晶体管类型:PNP;集电极电流(Ic):3A;集射极击穿电压(Vceo):30V;耗散功率(Pd):500mW;直流电流增益(hFE):400@1A,2V;; Manufacturer: R+O(宏嘉诚); AddInBom: yes; ModelId: 6db690b7897d4d18a30d90c1b89525ee; ModelName: SOT-89-3_L4.3-W2.5-H1.6-LS4.1-P1.50; ModelTransform: 161.417,169.291,0,180,0,0,-11.808,0,0; type: PNP; Current - Collector(Ic): 3A; Collector - Emitter Voltage VCEO: 30V; Pd - Power Dissipation: 500mW; Transition frequency(fT): 80MHz; Current - Collector Cutoff: 100nA; Vce Saturation(VCE(sat)): 500mV; Emitter-Base Voltage(Vebo): 6V; Symbol: B772_C41375134; LCSC Part Name: PNP 电流:3A 电压:30V; SupplierPart: C41375134; ManufacturerPart: B772; Supplier Footprint: SOT-89; JLCPCB Part Class: Extended Part; Datasheet: https://item.szlcsc.com/datasheet/B772/43142134.html; Supplier: LCSC; ConvertToPcb: yes; FootprintName: SOT-89-3_L4.5-W2.5-P1.50-LS4.2-BR; DC Current Gain: 400@1A,2V; Operating Temperature: -
R1 R2 R6 R8-R10 R12-R14 R16 R18-R20 R22-R24 R26 R28-R32 R39 R43-R45 R48-R50 R53 R56 R57 R59 R60 R63 R65-R68 R72-R75 R80 R82 R83 R116 R119 R121 R123 R127 R130 R134 R136 R137 R142 R143 R147-R150 R152 R159 R?#1-R?#9 R?#12-R?#21 = R-0603-100Ω-5%_2: 片式电阻; 物料描述: 片式电阻器-0805-10KΩ-5%-JT; 物料号: NA
R11 R27 R33 R37 R38 R40-R42 R61 R70 R71 = R-0603-100Ω-5%_20: 片式电阻; 物料描述: 片式电阻器-0805-10KΩ-5%-JT; 物料号: NA
R46 R217 R241-R244 = R-0603-100Ω-5%_10: 片式电阻; 物料描述: 片式电阻器-0805-10KΩ-5%-JT; 物料号: NA
R84-R93 R95 R97-R112 R114 R138 R140 R154-R158 R160-R162 R164 R166 R168-R180 = R-0603-100Ω-5%_15: 片式电阻; 物料描述: 片式电阻器-0805-10KΩ-5%-JT; 物料号: NA
R94 R96 R113 R115 R117 R118 R120 R122 R124-R126 R139 R144 R146 R165 R167 R181-R184 R186 R188 R189 R203-R206 R219 R226 R231 R?#22-R?#27 = R-0603-100Ω-5%_11: 片式电阻; 物料描述: 片式电阻器-0805-10KΩ-5%-JT; 物料号: NA
R128 R131-R133 R153 R163 = R-0603-100Ω-5%_4: 片式电阻; 物料描述: 片式电阻器-0805-10KΩ-5%-JT; 物料号: NA
R129 R239 = R-0603-100Ω-5%_16: 片式电阻; 物料描述: 片式电阻器-0805-10KΩ-5%-JT; 物料号: NA
R135 R211 R?#10 R?#11 R?#28 R?#29 = 3296w-1-202lf: 阻值:2kΩ;精度:±10%;功率:500mW;温度系数:±100ppm/℃;; Manufacturer: BOURNS; Symbol: 3296W-1-202LF_C83684; AddInBom: yes; ModelId: 3664f7b541aa4725a8b6d3b7a961f078; ModelTransform: 374.015,188.976,0,90,0,0,2.362,0.005,-137.795; Value: 2kΩ; Tolerance: ±10%; Power(Watts): 500mW; Number of Turns: 25; LCSC Part Name: 2kΩ ±10%; SupplierPart: C83684; ManufacturerPart: 3296W-1-202LF; Supplier Footprint: SIP-3P,9.5x4.8mm; JLCPCB Part Class: Extended Part; Datasheet: https://item.szlcsc.com/datasheet/3296W-1-202LF/84850.html; Supplier: LCSC; ConvertToPcb: yes; FootprintName: RES-ADJ-TH_3296W; ModelName: RES-ADJ-TH_3296W; Temperature Coefficient: ±100ppm/℃
R141 R145 R151 = R-0603-100Ω-5%_9: 片式电阻; 物料描述: 片式电阻器-0805-10KΩ-5%-JT; 物料号: NA
R185 R187 R191 R192 R202 R207 R208 R212-R215 R230 R234 = R-0603-100Ω-5%_6: 片式电阻; 物料描述: 片式电阻器-0805-10KΩ-5%-JT; 物料号: NA
R190 R193 R195 R200 R201 R209 R216 R218 R220-R223 R225 R227-R229 R232 R233 R245 R246 = R-0603-100Ω-5%_7: 片式电阻; 物料描述: 片式电阻器-0805-10KΩ-5%-JT; 物料号: NA
R196-R199 R210 R235-R238 R240 = R-0603-100Ω-5%_13: 片式电阻; 物料描述: 片式电阻器-0805-10KΩ-5%-JT; 物料号: NA
U1 = bf256b: 数量:1个N沟道;栅源击穿电压(Vgss):30V;耗散功率(Pd):350mW;导通电阻(RDS(on)):-;漏源电流(Idss):13mA;; Manufacturer: onsemi(安森美); AddInBom: yes; ModelId: 4ec6837dedfb4578a434f76110365bf1; ModelTransform: 180.3146,140.1572,0,180,0,0,0,23.465,-196.85; Number: 1个N沟道; Gate-Source Cutoff Voltage (VGS(off)): 500mV; Gate-Source Breakdown Voltage (Vgss): 30V; Pd - Power Dissipation: 350mW; Drain Current (Idss): 13mA; FET Type: N沟道; Symbol: BF256B; LCSC Part Name: 1个N沟道 500mV@10nA; SupplierPart: C2892081; ManufacturerPart: BF256B; Supplier Footprint: TO-92-3; JLCPCB Part Class: Extended Part; Datasheet: https://item.szlcsc.com/datasheet/BF256B/3122554.html; Supplier: LCSC; ConvertToPcb: yes; FootprintName: TO-92-3_L4.6-W3.9-P1.27-L; ModelName: TO-92-3_L4.6-W3.9-P1.27-L; RDS(on): -; Ciss-Input Capacitance: -; Operating Temperature: -55℃~+150℃; Configuration: -; Output Capacitance(Coss): -; Reverse Transfer Capacitance (Crss): -
ZD5-ZD7 ZD9 ZD11 ZD13 = DIO_ZENER_3: 20V稳压管; Brand: 10V; Part Number: *
ZD26 ZD33 = DIO_ZENER_6: 9V稳压管; Brand: 10V; Part Number: *
ZD65 = DIO_ZENER_2: 15V稳压管; Brand: 10V; Part Number: *
ZD69 = DIO_ZENER_5: 18V稳压管; Brand: 10V; Part Number: *
D3 = 1N4148W_C7420318: Symbol: 1N4148W_C7420318
R36 = 3296W-1-103_C48997937: Symbol: 3296W-1-103_C48997937